# Altium project OpenBCI Brain EEG.PrjPcb
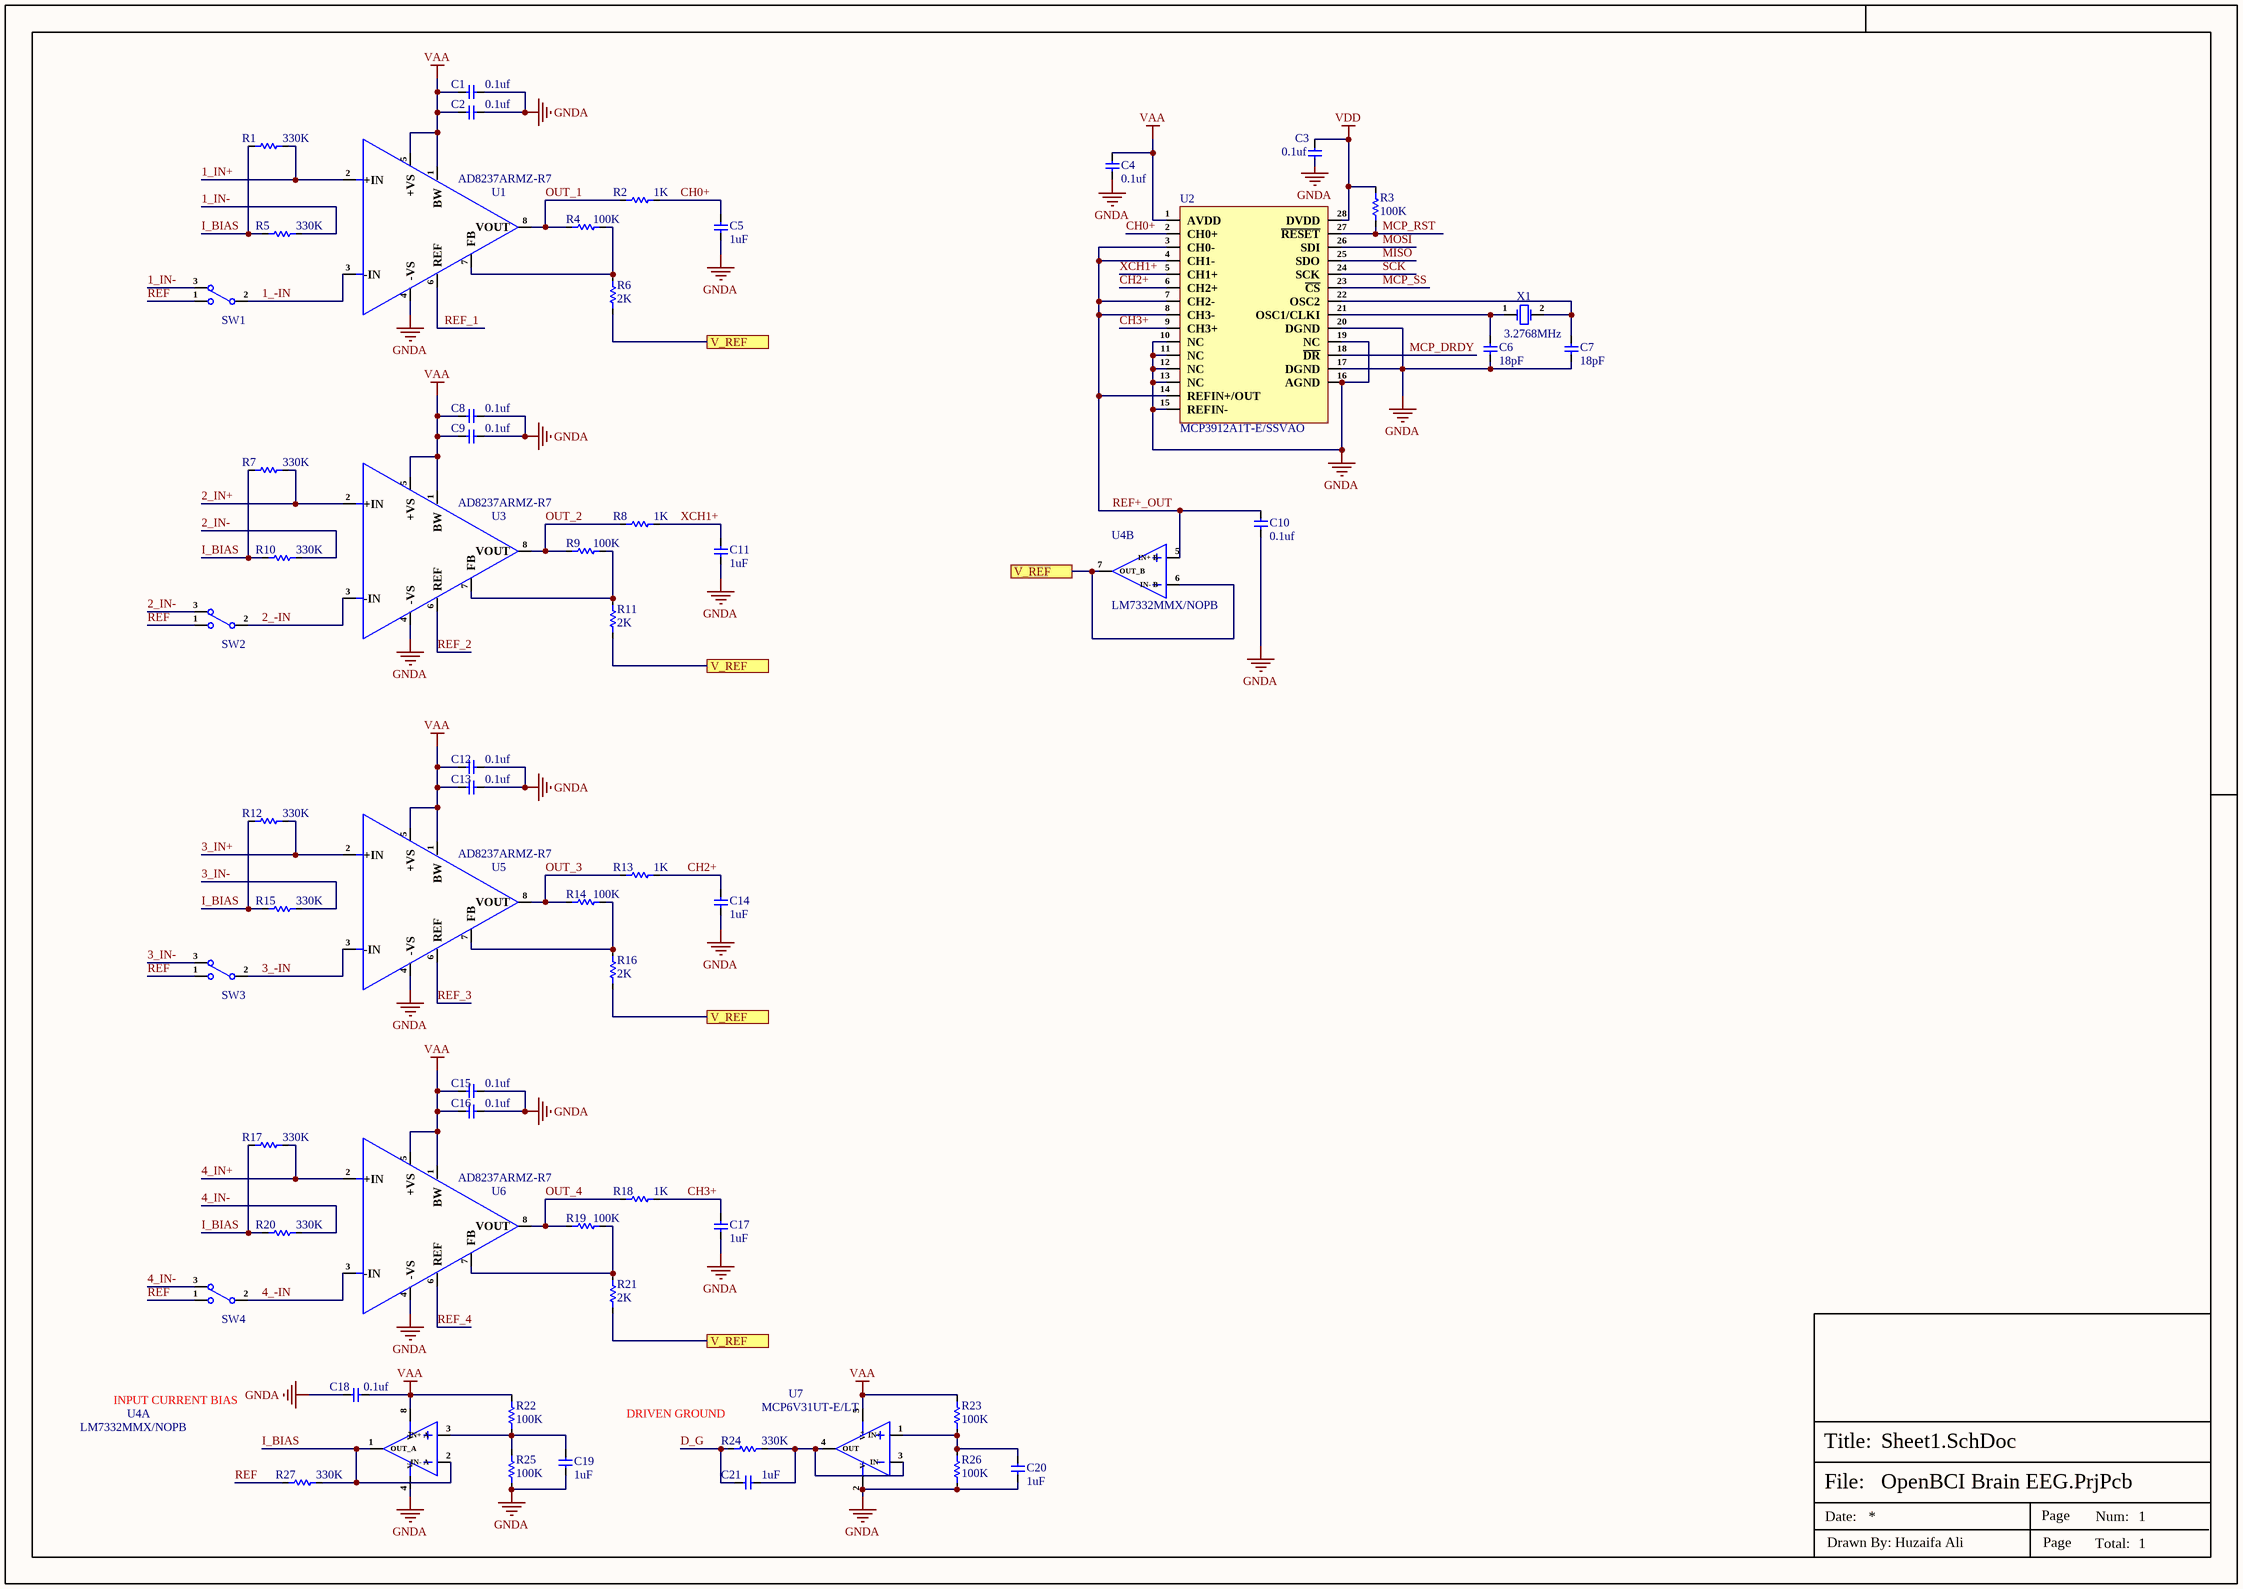
[diagram p0: Sheet1.SchDoc]
1 sheet, 60 parts. Net scope: flat (ports and power ports of the same name join across sheets).

## Sheet Sheet1.SchDoc
size 420 x 297 mm; SheetNumber: 1; SheetTotal: 1

### Parts
C1  0.1uf  [Cap-0402]
C2  0.1uf  [Cap-0402]
C3  0.1uf  [Cap-0402]
C4  0.1uf  [Cap-0402]
C5  1uF  [Cap-0402]
C6  18pF  [Cap-0402]
C7  18pF  [Cap-0402]
C8  0.1uf  [Cap-0402]
C9  0.1uf  [Cap-0402]
C10  0.1uf  [Cap-0402]
C11  1uF  [Cap-0402]
C12  0.1uf  [Cap-0402]
C13  0.1uf  [Cap-0402]
C14  1uF  [Cap-0402]
C15  0.1uf  [Cap-0402]
C16  0.1uf  [Cap-0402]
C17  1uF  [Cap-0402]
C18  0.1uf  [Cap-0402]
C19  1uF  [Cap-0402]
C20  1uF  [Cap-0402]
C21  1uF  [Cap-0402]
R1  330K  [Res-0402]
R2  1K  [Res-0402]
R3  100K  [Res-0402]
R4  100K  [Res-0402]
R5  330K  [Res-0402]
R6  2K  [Res-0402]
R7  330K  [Res-0402]
R8  1K  [Res-0402]
R9  100K  [Res-0402]
R10  330K  [Res-0402]
R11  2K  [Res-0402]
R12  330K  [Res-0402]
R13  1K  [Res-0402]
R14  100K  [Res-0402]
R15  330K  [Res-0402]
R16  2K  [Res-0402]
R17  330K  [Res-0402]
R18  1K  [Res-0402]
R19  100K  [Res-0402]
R20  330K  [Res-0402]
R21  2K  [Res-0402]
R22  100K  [Res-0402]
R23  100K  [Res-0402]
R24  330K  [Res-0402]
R25  100K  [Res-0402]
R26  100K  [Res-0402]
R27  330K  [Res-0402]
SW1  CJS-1200TA  [CJS-1200TA]  (value not drawn)
SW2  CJS-1200TA  [CJS-1200TA]  (value not drawn)
SW3  CJS-1200TA  [CJS-1200TA]  (value not drawn)
SW4  CJS-1200TA  [CJS-1200TA]  (value not drawn)
U1  AD8237ARMZ-R7  [MSOP-8]
U2  MCP3912A1T-E/SSVAO  [SSOP-28-208mil]
U3  AD8237ARMZ-R7  [MSOP-8]
U4  LM7332MMX/NOPB  [VSSOP-8]  (parts A,B of 2)
U5  AD8237ARMZ-R7  [MSOP-8]
U6  AD8237ARMZ-R7  [MSOP-8]
U7  MCP6V31UT-E/LT  [SC-70-5]
X1  3.2768MHz  [HC-49S-SMD]

### Ports
V_REF

### Nets
GNDA: C1.1 C2.1 C3.1 C4.2 C5.1 C6.1 C7.1 C8.1 C9.1 C10.2 C11.1 C12.1 C13.1 C14.1 C15.1 C16.1 C17.1 C18.1 C19.1 C20.2 R25.1 R26.1 U1.4(-VS) U2.10(NC) U2.11(NC) U2.12(NC) U2.13(NC) U2.15(REFIN-) U2.16(AGND) U2.17(DGND) U2.19(NC) U2.20(DGND) U3.4(-VS) U4.4(V-) U5.4(-VS) U6.4(-VS) U7.2(V-)
VAA: C1.2 C2.2 C4.1 C8.2 C9.2 C12.2 C13.2 C15.2 C16.2 C18.2 R22.2 R23.2 U1.1(BW) U1.5(+VS) U2.1(AVDD) U3.1(BW) U3.5(+VS) U4.8(V+) U5.1(BW) U5.5(+VS) U6.1(BW) U6.5(+VS) U7.5(V+)
VDD: C3.2 R3.2 U2.28(DVDD)
1_-IN: SW1.2(COM) U1.3(-IN)
1_IN+: R1.1 U1.2(+IN)
1_IN-: R5.2 SW1.3(NO)
2_-IN: SW2.2(COM) U3.3(-IN)
2_IN+: R7.1 U3.2(+IN)
2_IN-: R10.2 SW2.3(NO)
3_-IN: SW3.2(COM) U5.3(-IN)
3_IN+: R12.1 U5.2(+IN)
3_IN-: R15.2 SW3.3(NO)
4_-IN: SW4.2(COM) U6.3(-IN)
4_IN+: R17.1 U6.2(+IN)
4_IN-: R20.2 SW4.3(NO)
CH0+: C5.2 R2.2 U2.2(CH0+)
CH2+: C14.2 R13.2 U2.6(CH2+)
CH3+: C17.2 R18.2 U2.9(CH3+)
D_G: C21.2 R24.1
I_BIAS: R1.2 R5.1 R7.2 R10.1 R12.2 R15.1 R17.2 R20.1 R27.2 U4.1(OUT_A) U4.2(IN-_A)
MCP_DRDY: U2.18(~{DR})
MCP_RST: R3.1 U2.27(~{RESET})
MCP_SS: U2.23(~{CS})
MISO: U2.25(SDO)
MOSI: U2.26(SDI)
OUT_1: R2.1 R4.1 U1.8(VOUT)
OUT_2: R8.1 R9.1 U3.8(VOUT)
OUT_3: R13.1 R14.1 U5.8(VOUT)
OUT_4: R18.1 R19.1 U6.8(VOUT)
REF: R27.1 SW1.1(NC) SW2.1(NC) SW3.1(NC) SW4.1(NC)
REF+_OUT: C10.1 U2.3(CH0-) U2.4(CH1-) U2.7(CH2-) U2.8(CH3-) U2.14(REFIN+/OUT) U4.5(IN+_B)
REF_1: U1.6(REF)
REF_2: U3.6(REF)
REF_3: U5.6(REF)
REF_4: U6.6(REF)
SCK: U2.24(SCK)
XCH1+: C11.2 R8.2 U2.5(CH1+)
NetC6_2: C6.2 U2.21(OSC1/CLKI) X1.1(OSC1)
NetC7_2: C7.2 U2.22(OSC2) X1.2(OSC2)
NetC19_2: C19.2 R22.1 R25.2 U4.3(IN+_A)
NetC20_1: C20.1 R23.1 R26.2 U7.1(IN+)
NetC21_1: C21.1 R24.2 U7.3(IN-) U7.4(OUT)
NetR4_2: R4.2 R6.2 U1.7(FB)
NetR6_1: R6.1 R11.1 R16.1 R21.1 U4.6(IN-_B) U4.7(OUT_B) ; port V_REF
NetR9_2: R9.2 R11.2 U3.7(FB)
NetR14_2: R14.2 R16.2 U5.7(FB)
NetR19_2: R19.2 R21.2 U6.7(FB)

### Notes on the sheet
- INPUT CURRENT BIAS
- (near R24) DRIVEN GROUND
- File:
- Title:
- Date:
- Page
- Num:
- Total:
- Drawn By: Huzaifa Ali

### Library data of the parts
C1-C4 C8-C10 C12 C13 C15 C16 C18 = GRM155R62A104KE14D: CAP CER 0.1UF 100V X5R 0402; Manufacturer: Murata; Capacitance: 100nF; Tolerance: 10%; Item Type: Capacitor; Supplier 1: Arrow Electronics; Manufacturer Part Number: GRM155R62A104KE14D; RoHS: Yes; Category: Ceramic Capacitors; Stock 1: 870000; Pricing 1: 10000=0.00500, 20000=0.00410, 30000=0.00390, 50000=0.00370, 100000=0.00300 (USD); Mount: Surface Mount; Case/Package: 0402; Case Code (Metric): 1005; Case Code (Imperial): 0402; Weight: 0.000212oz; Min Operating Temperature: -55°C; Max Operating Temperature: 85°C; Packaging: Tape and Reel; Voltage Rating: 100V; Dielectric: X5R; Termination: SMD/SMT; Voltage Rating (DC): 100V; Package Quantity: 10000; Series: GRM; Length: 0.039inch; Width: 0.02inch; Height: 0.5mm; Thickness: 0.022inch; Reach SVHC Compliant: Yes; Lead Free: Lead Free; RoHS Compliant: Yes; ComponentLink1URL: http://www.farnell.com/datasheets/2079151.pdf?src-supplier=Farnell; ComponentLink1Description: http://www.farnell.com/datasheets/2079151.pdf?src-supplier=Farnell; ComponentLink2URL: http://www.mouser.com/ds/2/281/c02e-2905.pdf?src-supplier=Mouser; ComponentLink2Description: http://www.mouser.com/ds/2/281/c02e-2905.pdf?src-supplier=Mouser; ComponentLink3URL: http://www.farnell.com/datasheets/2079151.pdf?src-supplier=Element14; ComponentLink3Description: http://www.farnell.com/datasheets/2079151.pdf?src-supplier=Element14; ComponentLink4URL: http://search.murata.co.jp/Ceramy/image/img/A01X/G101/ENG/GRM155R62A104KE14-01.pdf?src-supplier=Digi-Key; ComponentLink4Description: http://search.murata.co.jp/Ceramy/image/img/A01X/G101/ENG/GRM155R62A104KE14-01.pdf?src-supplier=Digi-Key; ComponentLink5URL: http://www.farnell.com/datasheets/2079151.pdf?src-supplier=Newark; ComponentLink5Description: http://www.farnell.com/datasheets/2079151.pdf?src-supplier=Newark; Supplier Part Number 1: GRM155R62A104KE14D; LCSC Part Number: C162178
C5 C11 C14 C17 C19-C21 = C1005X5R1V105K050BC: CAP CER 1UF 35V X5R 0402; Manufacturer: TDK; Item Type: Capacitors; Dielectric Material: Ceramic; Material: 4241ConductorMaterial; Tolerance: 10%; Supplier: Digikey; Supplier Part Number: 445-9073-1-ND; Manufacturer Part Number: C1005X5R1V105K050BC; RoHS: Yes; Stock: 682645; Pricing: 1=0.15, 10=0.087, 50=0.061, 100=0.0528, 500=0.03898, 1000=0.03468, 2500=0.03011, 5000=0.02735 (USD); Mounting Technology: Surface Mount; Case/Package: 0402; Case Code (Metric): 1005; Case Code (Imperial): 0402; Min Operating Temperature: -55°C; Max Operating Temperature: 85°C; Value: 1uF; Voltage Rating: 35V; Packaging: Tape and Reel; Dielectric: X5R; Series: C; Length: 1mm; Depth: 0.5mm; Radiation Hardening: No; Reach SVHC Compliant: No; Lead Free: Lead Free; RoHS Compliant: Yes; ComponentLink1URL: https://datasheet.ciiva.com/26834/getdatasheetpartid-750449-26834298.pdf?src-supplier=Verical; ComponentLink1Description: https://datasheet.ciiva.com/26834/getdatasheetpartid-750449-26834298.pdf?src-supplier=Verical; ComponentLink2URL: https://datasheet.ciiva.com/28451/1796654-28451087.pdf?src-supplier=Element14; ComponentLink2Description: https://datasheet.ciiva.com/28451/1796654-28451087.pdf?src-supplier=Element14; ComponentLink3URL: https://datasheet.ciiva.com/22719/1796654-22719533.pdf?src-supplier=Element14; ComponentLink3Description: https://datasheet.ciiva.com/22719/1796654-22719533.pdf?src-supplier=Element14
C6 C7 = CC0402JRNPO9BN180: CAP CER 18PF 50V C0G/NPO 0402; Manufacturer: Yageo; Item Type: Capacitors; Tolerance: 5%; Dielectric: C0G; Temperature Coefficient: 30ppm/°C; Supplier: Rs; LCSC Part Number: C106202; Manufacturer Part Number: CC0402JRNPO9BN180; RoHS: Yes; Stock: 12000; Mounting Technology: Surface Mount; Case/Package: 0402; Pins: 2; Case Code (Metric): 1005; Case Code (Imperial): 0402; Weight: 2.3E-05oz; Min Operating Temperature: -55°C; Max Operating Temperature: 125°C; Value: 18pF; Voltage Rating: 50V; Packaging: Tape and Reel; Termination: SMD/SMT; Series: CC; Voltage Rating (DC): 50V; Voltage: 50V; Length: 1mm; Width: 0.5mm; Height: 0.5mm; Depth: 0.5mm; Radiation Hardening: No; RoHS Compliant: Yes; Reach SVHC Compliant: No; Lead Free: Lead Free; Halogen Free: 5694HalogenFree; ComponentLink1URL: https://datasheet.ciiva.com/11788/0900766b80d84fbf-11788369.pdf?src-supplier=Rs; ComponentLink1Description: https://datasheet.ciiva.com/11788/0900766b80d84fbf-11788369.pdf?src-supplier=Rs; ComponentLink2URL: https://datasheet.ciiva.com/28450/1443161-28450232.pdf?src-supplier=Element14; ComponentLink2Description: https://datasheet.ciiva.com/28450/1443161-28450232.pdf?src-supplier=Element14; ComponentLink3URL: https://datasheet.ciiva.com/176/mlccorderingcode-176358.pdf?src-supplier=Digikey; ComponentLink3Description: https://datasheet.ciiva.com/176/mlccorderingcode-176358.pdf?src-supplier=Digikey; ComponentLink4URL: https://datasheet.ciiva.com/176/mlccorderingcode-176357.pdf?src-supplier=Digikey; ComponentLink4Description: https://datasheet.ciiva.com/176/mlccorderingcode-176357.pdf?src-supplier=Digikey; ComponentLink5URL: https://datasheet.ciiva.com/176/mlccorderingcode-176359.pdf?src-supplier=Digikey; ComponentLink5Description: https://datasheet.ciiva.com/176/mlccorderingcode-176359.pdf?src-supplier=Digikey; ComponentLink6URL: https://datasheet.ciiva.com/13208/upy-gp-np0-16v-to-50v-8-13208430.pdf?src-supplier=Mouser; ComponentLink6Description: https://datasheet.ciiva.com/13208/upy-gp-np0-16v-to-50v-8-13208430.pdf?src-supplier=Mouser; ComponentLink7URL: https://datasheet.ciiva.com/11587/upy-gp-np0-16v-to-50v-8-11587087.pdf?src-supplier=Avnet; ComponentLink7Description: https://datasheet.ciiva.com/11587/upy-gp-np0-16v-to-50v-8-11587087.pdf?src-supplier=Avnet
R1 R5 R7 R10 R12 R15 R17 R20 R24 R27 = CRCW0402330KFKEDC: RES 330K OHM 1% 1/16W 0402; Manufacturer: Vishay; Power Rating: 63mW; Value: 330kR; Item Type: Resistor; Supplier: Mouser; Supplier Part Number: 71-CRCW0402330KFKEDC; Manufacturer Part Number: CRCW0402330KFKEDC; RoHS: Yes; Category: Chip SMD Resistors; Stock: 34154; Pricing: 1=0.1, 10=0.017, 50=0.017, 100=0.008, 1000=0.005, 10000=0.004 (USD); Case/Package: 0402; Tolerance: 1%; Lead Free: Lead Free; RoHS Compliant: Yes; LCSC Part Number: C3009051
R2 R8 R13 R18 = CRCW04021K00FKEDHP: RES SMD 1K OHM 1% 1/5W 0402; Manufacturer: Vishay Dale; Resistance: 1kR; Temperature Coefficient: 100ppm/°C; Power Rating: 125mW; Voltage Rating: 50V; Supplier 1: Digi-Key; Manufacturer Part Number: CRCW04021K00FKEDHP; Stock 1: 315989; Pricing 1: 1=0.15, 10=0.132, 100=0.0506, 1000=0.02226, 2500=0.01923, 5000=0.0172 (USD); Mount: Surface Mount; Case/Package: 0402; Number of Pins: 2; Contact Plating: Tin; Weight: 2.3E-05oz; Case Code (Imperial): 0402; Case Code (Metric): 1005; Size Code: 0402; Min Operating Temperature: -55°C; Max Operating Temperature: 155°C; Tolerance: 1%; Resistor Type: Thick Film; Package Quantity: 10; Packaging: Tape and Reel; Number of Terminations: 2; Termination: SMD/SMT; Max Power Dissipation: 125mW; Voltage Rating (DC): 50V; Features: Automotive AEC-Q200; Series: CRCW-HP; Construction: Rectangular; Technology: THICK FILM; Resistance Tolerance: 1%; Length: 1mm; Width: 0.5mm; Height: 0.3mm; Depth: 0.5mm; Radiation Hardening: No; REACH SVHC: Unknown; Military Standard: Not; Lead Free: Lead Free; RoHS Compliant: Yes; ComponentLink1URL: http://www.farnell.com/datasheets/2339608.pdf?src-supplier=Element14; ComponentLink1Description: http://www.farnell.com/datasheets/2339608.pdf?src-supplier=Element14; ComponentLink2URL: http://www.vishay.com/docs/20043/crcwhpe3.pdf?src-supplier=Digi-Key; ComponentLink2Description: http://www.vishay.com/docs/20043/crcwhpe3.pdf?src-supplier=Digi-Key; ComponentLink3URL: http://www.mouser.com/ds/2/427/crcwhpe3-46056.pdf?src-supplier=Mouser; ComponentLink3Description: http://www.mouser.com/ds/2/427/crcwhpe3-46056.pdf?src-supplier=Mouser; ComponentLink4URL: http://www.vishay.com/docs/20043/crcwhpe3.pdf?src-supplier=Avnet; ComponentLink4Description: http://www.vishay.com/docs/20043/crcwhpe3.pdf?src-supplier=Avnet; ComponentLink5URL: http://www.vishay.com/docs/20043/crcwhpe3.pdf?src-supplier=Future+Electronics; ComponentLink5Description: http://www.vishay.com/docs/20043/crcwhpe3.pdf?src-supplier=Future+Electronics; Supplier Part Number 1: 541-1.00KYCT-ND; LCSC Part Number: C313354
R3 R4 R9 R14 R19 R22 R23 R25 R26 = RT0402BRD07100KL: RES SMD 100K OHM 0.1% 1/16W 0402; Manufacturer: Yageo; Voltage Rating (DC): 50V; Item Type: Resistor; Supplier: Digikey; Supplier Part Number: YAG1343CT-ND; Manufacturer Part Number: RT0402BRD07100KL; RoHS: Yes; Category: Chip SMD Resistors; Stock: 62932; Pricing: 1=0.16, 10=0.121, 50=0.0958, 100=0.0859, 500=0.0654, 1000=0.0578, 5000=0.04283 (USD); ComponentLink1URL: https://datasheet.ciiva.com/12724/pyu-rt-1-to-0-05-rohs-l-4-12724954.pdf?src-supplier=Mouser; ComponentLink1Description: https://datasheet.ciiva.com/12724/pyu-rt-1-to-0-05-rohs-l-4-12724954.pdf?src-supplier=Mouser; LCSC Part Number: C852472
R6 R11 R16 R21 = RC0402FR-072KL: RES 2K OHM 1% 1/16W 0402; Manufacturer: Yageo; Item Type: Resistor; Value: 2kR; Power Rating: 63mW; Voltage Rating: 50V; Temperature Coefficient: 100ppm/°C; LCSC Part Number: C60488; ComponentLink2URL: https://datasheet.ciiva.com/11808/0900766b80c66297-11808787.pdf?src-supplier=Rs; ComponentLink2Description: https://datasheet.ciiva.com/11808/0900766b80c66297-11808787.pdf?src-supplier=Rs; ComponentLink3URL: https://datasheet.ciiva.com/7849/1018594-7849934.pdf?src-supplier=Element14; ComponentLink3Description: https://datasheet.ciiva.com/7849/1018594-7849934.pdf?src-supplier=Element14; ComponentLink4URL: https://datasheet.ciiva.com/7849/1018594-7849935.pdf?src-supplier=Element14; ComponentLink4Description: https://datasheet.ciiva.com/7849/1018594-7849935.pdf?src-supplier=Element14; ComponentLink5URL: https://datasheet.ciiva.com/7983/1018594-7983517.pdf?src-supplier=Element14; ComponentLink5Description: https://datasheet.ciiva.com/7983/1018594-7983517.pdf?src-supplier=Element14; ComponentLink6URL: https://datasheet.ciiva.com/2453/pyu-r-int-thick-7-2453635.pdf?src-supplier=Digi-Key; ComponentLink6Description: https://datasheet.ciiva.com/2453/pyu-r-int-thick-7-2453635.pdf?src-supplier=Digi-Key; ComponentLink7URL: https://datasheet.ciiva.com/2453/pyu-r-int-thick-7-2453636.pdf?src-supplier=Digi-Key; ComponentLink7Description: https://datasheet.ciiva.com/2453/pyu-r-int-thick-7-2453636.pdf?src-supplier=Digi-Key; ComponentLink8URL: https://datasheet.ciiva.com/2453/pyu-r-int-thick-7-2453634.pdf?src-supplier=Digi-Key; ComponentLink8Description: https://datasheet.ciiva.com/2453/pyu-r-int-thick-7-2453634.pdf?src-supplier=Digi-Key; ComponentLink9URL: https://datasheet.ciiva.com/12667/pyu-rc0402-51-rohs-l-6-r-12667451.pdf?src-supplier=Mouser; ComponentLink9Description: https://datasheet.ciiva.com/12667/pyu-rc0402-51-rohs-l-6-r-12667451.pdf?src-supplier=Mouser; ComponentLink10URL: https://datasheet.ciiva.com/15189/getdatasheetpartid-358921-15189414.pdf?src-supplier=Verical; ComponentLink10Description: https://datasheet.ciiva.com/15189/getdatasheetpartid-358921-15189414.pdf?src-supplier=Verical; Supplier: Future Electronics; Supplier Part Number: 7970452; Manufacturer Part Number: RC0402FR-072KL; RoHS: Yes; Category: Chip SMD Resistors; Stock: 8530000; Pricing: 10000=0.0018, 100000=0.0011, 200000=0.0017, 300000=0.001, 750000=0.0016, 2000000=0.0009, 2500000=0.0016, 10000000=0.0014 (USD); Case/Package: 0402; Case Code (Metric): 1005; Case Code (Imperial): 0402; Min Operating Temperature: -55°C; Max Operating Temperature: 155°C; Resistor Type: Thick Film; Tolerance: 1%; Package Quantity: 1; Packaging: Tape and Reel; Number of Terminations: 2; Termination: SMD/SMT; Max Power Dissipation: 63mW; Working Voltage: 50V; Features: Moisture Resistant; Series: RC; Technology: THICK FILM; Construction: Rectangular; Resistance Tolerance: 1%; Voltage Rating (DC): 50V; Length: 0.039inch; Width: 0.02inch; Height: 0.016inch; Depth: 0.5mm; RoHS Compliant: Yes; Military Standard: Not; Reach SVHC Compliant: Unknown; Lead Free: 5697LeadFree; ComponentLink1URL: https://datasheet.ciiva.com/11808/0900766b80c66297-11808787.pdf?src-supplier=Rs; ComponentLink1Description: https://datasheet.ciiva.com/11808/0900766b80c66297-11808787.pdf?src-supplier=Rs; ComponentLink11URL: https://datasheet.ciiva.com/2453/pyu-r-int-thick-7-2453635.pdf?src-supplier=Digikey; ComponentLink11Description: https://datasheet.ciiva.com/2453/pyu-r-int-thick-7-2453635.pdf?src-supplier=Digikey; ComponentLink12URL: https://datasheet.ciiva.com/2453/pyu-r-int-thick-7-2453636.pdf?src-supplier=Digikey; ComponentLink12Description: https://datasheet.ciiva.com/2453/pyu-r-int-thick-7-2453636.pdf?src-supplier=Digikey; ComponentLink13URL: https://datasheet.ciiva.com/2453/pyu-r-int-thick-7-2453634.pdf?src-supplier=Digikey; ComponentLink13Description: https://datasheet.ciiva.com/2453/pyu-r-int-thick-7-2453634.pdf?src-supplier=Digikey
SW1-SW4 = CJS-1200TA: SWITCH SLIDE SPDT 100MA 6V; Manufacturer: Nidec Copal; Item Type: DIP Switches; Actuator Material: Nylon,Polyamide; Electrical Life: 200Cycles; Max Voltage Rating (DC): 24V; Switch Function: On-On; Switch Travel: 0.6mm; Operating Force: 600gf; Supplier: Digikey; Manufacturer Part Number: CJS-1200TA; RoHS: Yes; Stock: 28637; Pricing: 1=1.12, 10=0.915, 25=0.8424, 100=0.7418, 250=0.68124, 500=0.63826 (USD); Mounting Technology: Surface Mount; Contact Material: Copper Alloy; Contact Plating: Gold; Min Operating Temperature: -40°C; Max Operating Temperature: 85°C; Packaging: Tape and Reel; Throw Configuration: SPDT; Voltage Rating (DC): 6V; Termination: J-Hook; Series: CJS; Orientation: Vertical; Contact Current Rating: 100mA; Radiation Hardening: No; RoHS Compliant: Yes; Lead Free: Lead Free; ComponentLink1URL: https://datasheet.ciiva.com/2864/cjs-2864477.pdf?src-supplier=Digikey; ComponentLink1Description: https://datasheet.ciiva.com/2864/cjs-2864477.pdf?src-supplier=Digikey; ComponentLink2URL: https://datasheet.ciiva.com/2864/cjs-2864476.pdf?src-supplier=Digikey; ComponentLink2Description: https://datasheet.ciiva.com/2864/cjs-2864476.pdf?src-supplier=Digikey; ComponentLink3URL: https://datasheet.ciiva.com/2864/cjs-2864478.pdf?src-supplier=Digikey; ComponentLink3Description: https://datasheet.ciiva.com/2864/cjs-2864478.pdf?src-supplier=Digikey
U1 U3 U5 U6 = AD8237ARMZ-R7: IC INST AMP 1 CIRCUIT 8MSOP; Manufacturer: Analog Devices; Supplier: Mouser; LCSC Part Number: C12086; Manufacturer Part Number: AD8237ARMZ-R7; RoHS: Yes; Item Type: IC; Stock: 141226; Pricing: 1=2.88, 10=2.37, 50=2.37, 100=2.13, 1000=1.56, 10000=1.47 (USD); ComponentLink1URL: https://datasheet.ciiva.com/6626/ad8237-6626733.pdf?src-supplier=Digikey; ComponentLink1Description: https://datasheet.ciiva.com/6626/ad8237-6626733.pdf?src-supplier=Digikey; ComponentLink2URL: https://datasheet.ciiva.com/8582/ad8237-8582303.pdf?src-supplier=Avnet; ComponentLink2Description: https://datasheet.ciiva.com/8582/ad8237-8582303.pdf?src-supplier=Avnet
U2 = MCP3912A1T-E/SSVAO: FOUR CHANNEL ENERGY METER FRONT; Manufacturer: Microchip Technology; Item Type: IC; Manufacturer Part Number: MCP3912A1T-E/SSVAO; Package: 28-SSOP; LCSC Part Number: -; ComponentLink1Description: Digikey; ComponentLink1URL: https://www.digikey.com/en/products/detail/microchip-technology/MCP3912A1T-E-SSVAO/19917129?s=N4IgTCBcDaILIGEAKBmAnARggXQL5A
U4 = LM7332MMX/NOPB: IC OPAMP GP 2 CIRCUIT 8VSSOP; Manufacturer: TI National Semiconductor; Supplier: Mouser; LCSC Part Number: C1848183; Manufacturer Part Number: LM7332MMX/NOPB; RoHS: No; Item Type: IC; Stock: 5379; Pricing: 1=3.1, 10=2.13, 50=2.13, 100=1.92, 1000=1.7, 10000=1.67 (USD); ComponentLink1URL: https://datasheet.ciiva.com/14463/lm7332-14463062.pdf?src-supplier=Avnet; ComponentLink1Description: https://datasheet.ciiva.com/14463/lm7332-14463062.pdf?src-supplier=Avnet; ComponentLink2URL: https://datasheet.ciiva.com/6628/lm7332-6628237.pdf?src-supplier=Digikey; ComponentLink2Description: https://datasheet.ciiva.com/6628/lm7332-6628237.pdf?src-supplier=Digikey
U7 = MCP6V31UT-E/LT: IC OPAMP ZERO-DRIFT 1CIRC SC70-5; Manufacturer: Microchip; Supplier: Arrow Electronics; LCSC Part Number: C623527; Manufacturer Part Number: MCP6V31UT-E/LT; RoHS: Yes; Item Type: IC; Stock: 2169; Pricing: 1=1.399, 10=1.377, 25=1.356, 100=1.334, 250=1.313, 500=1.291, 1000=1.27 (USD); ComponentLink1URL: https://datasheet.ciiva.com/8079/1599560-8079067.pdf?src-supplier=Element14; ComponentLink1Description: https://datasheet.ciiva.com/8079/1599560-8079067.pdf?src-supplier=Element14; ComponentLink2URL: https://datasheet.ciiva.com/6627/25127a-6627383.pdf?src-supplier=Digikey; ComponentLink2Description: https://datasheet.ciiva.com/6627/25127a-6627383.pdf?src-supplier=Digikey; ComponentLink3URL: https://datasheet.ciiva.com/6627/25127a-6627384.pdf?src-supplier=Digikey; ComponentLink3Description: https://datasheet.ciiva.com/6627/25127a-6627384.pdf?src-supplier=Digikey; ComponentLink4URL: https://datasheet.ciiva.com/6627/25127a-6627385.pdf?src-supplier=Digikey; ComponentLink4Description: https://datasheet.ciiva.com/6627/25127a-6627385.pdf?src-supplier=Digikey; ComponentLink5URL: https://datasheet.ciiva.com/2966/25127a-2966474.pdf?src-supplier=Avnet; ComponentLink5Description: https://datasheet.ciiva.com/2966/25127a-2966474.pdf?src-supplier=Avnet; ComponentLink6URL: https://datasheet.ciiva.com/26922/getdatasheetpartid-556897-26922826.pdf?src-supplier=Verical; ComponentLink6Description: https://datasheet.ciiva.com/26922/getdatasheetpartid-556897-26922826.pdf?src-supplier=Verical; ComponentLink7URL: https://datasheet.ciiva.com/16338/filehandler-aspxddocname-en557758-16338408.pdf?src-supplier=Future+Electronics; ComponentLink7Description: https://datasheet.ciiva.com/16338/filehandler-aspxddocname-en557758-16338408.pdf?src-supplier=Future+Electronics
X1 = ABLS-LR-3.2768MHZ-T: CRYSTAL 3.2768MHZ 18PF SMD; Manufacturer: Abracon; Item Type: Crystals; Supplier: Mouser; Supplier Part Number: 815-ABLS-LR-3.27M-T; Manufacturer Part Number: ABLS-LR-3.2768MHZ-T; RoHS: Yes; Stock: 427; Pricing: 1=2.39, 10=2.12, 50=2.1, 100=2.09, 1000=2.04, 10000=2.02 (USD); ComponentLink1URL: https://datasheet.ciiva.com/856/abls-lr-856736.pdf?src-supplier=Digikey; ComponentLink1Description: https://datasheet.ciiva.com/856/abls-lr-856736.pdf?src-supplier=Digikey; ComponentLink2URL: https://datasheet.ciiva.com/16423/abls-lr-16423580.pdf?src-supplier=Future+Electronics; ComponentLink2Description: https://datasheet.ciiva.com/16423/abls-lr-16423580.pdf?src-supplier=Future+Electronics; ComponentLink3URL: https://datasheet.ciiva.com/856/abls-lr-856735.pdf?src-supplier=Digikey; ComponentLink3Description: https://datasheet.ciiva.com/856/abls-lr-856735.pdf?src-supplier=Digikey; ComponentLink4URL: https://datasheet.ciiva.com/856/abls-lr-856737.pdf?src-supplier=Digikey; ComponentLink4Description: https://datasheet.ciiva.com/856/abls-lr-856737.pdf?src-supplier=Digikey; ComponentLink5URL: https://datasheet.ciiva.com/3175/abls-lr-3175479.pdf?src-supplier=Avnet; ComponentLink5Description: https://datasheet.ciiva.com/3175/abls-lr-3175479.pdf?src-supplier=Avnet